# Altium schematic sheet MainCurrent.SchDoc
size A4; SheetNumber: 13; SheetTotal: 15
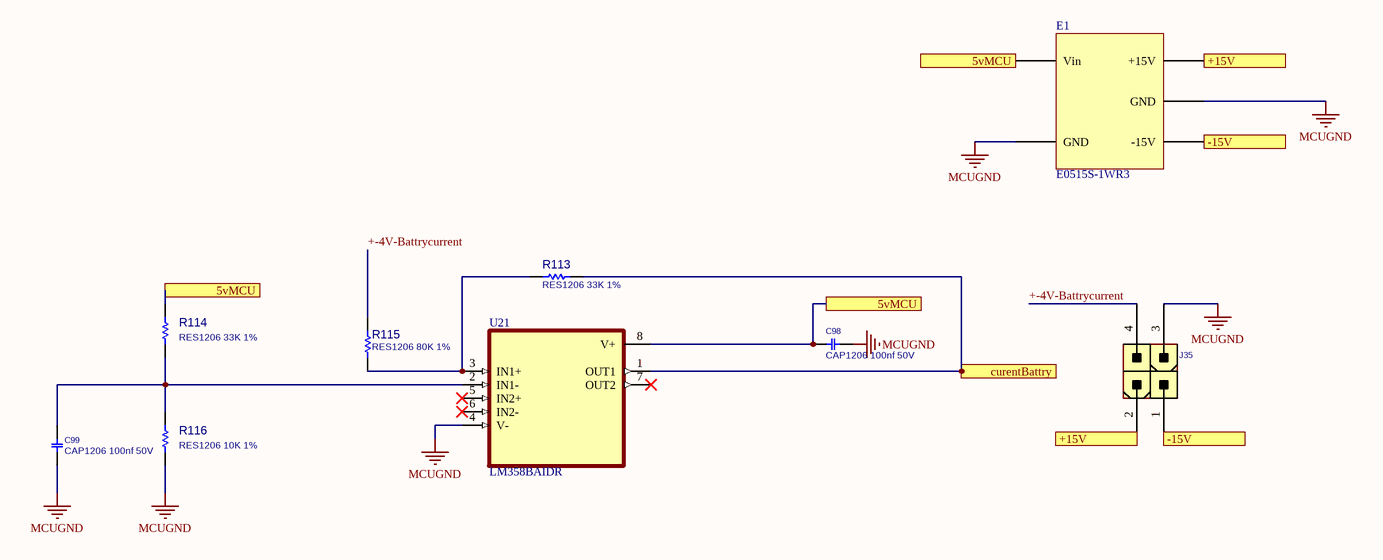
[diagram p0: MainCurrent.SchDoc]

## Parts
C98  CAP1206 100nf 50V  [C1206]
C99  CAP1206 100nf 50V  [C1206]
E1  E0515S-1WR3  [PCBComponent_1]
J35  CONN_ATXPWR_4  [ATXPWR_4]  (value not drawn)
R113  RES1206 33K 1%  [R1206]
R114  RES1206 33K 1%  [R1206]
R115  RES1206 80K 1%  [R1206]
R116  RES1206 10K 1%  [R1206]
U21  LM358BAIDR  [SOIC127P599X175-8N]

## Ports
5vMCU, +15V, -15V, curentBattry

## Nets
MCUGND: C98.1 C99.1 E1.1(GND) E1.3(GND) J35.3 R116.1 U21.4(V-)
5vMCU: C98.2 E1.0(Vin) R114.2 U21.8(V+) ; port 5vMCU
+15V: E1.4(+15V) J35.2 ; port +15V
+-4V-Battrycurrent: J35.4 R115.2
-15V: E1.2(-15V) J35.1 ; port -15V
curentBattry: R113.2 U21.1(OUT1) ; port curentBattry
NetC99_2: C99.2 R114.1 R116.2 U21.2(IN1-)
NetR113_1: R113.1 R115.1 U21.3(IN1+)

Not connected (* = marked no-connect by the designer): U21 5(IN2+)* 6(IN2-)* 7(OUT2)*

## Library data of the parts
C98 C99 = CAP_SMD_MLCC_1206: CAP, MLCC; PARAM: -, -%; MANF_P#: MANF_PART#; PARAM2: -V; PRICE: 100= 1$; MANF: -; ASSEMBLY: ASSEMBLY
E1 = a0505s-?
J35 = CONN_ATXPWR_4: CONN, ATX POWER, 4 P; MANF: TE, Molex; MANF_P#: 4-1775099-0, 39281043; VALUE: CONN_ATXPWR_4; MountType: THD; PACKAGE: ATXPWR-4pin; Part Type: Conn.
R113-R116 = RES_SMD_1206: RESISTOR, SMD; PARAM: 1%, 0.25W; DESC: DESCRIPTION; DIST#: MOUSER; MANF_P#: -; MANF: -; ASSEMBLY: ASSEMBLY; PRICE: -; PARAM2: -
U21 = LM358BAIDR: Dual, 36-V, 1.2-MHz, 2-mV offset voltage operational amplifier; MF: Texas Instruments; SnapEDA_Link: https://www.snapeda.com/parts/LM358BAIDR/Texas+Instruments/view-part/?ref=snap; Package: SOIC-8 Texas Instruments; Value: *; MP: LM358BAIDR; Check_prices: https://www.snapeda.com/parts/LM358BAIDR/Texas+Instruments/view-part/?ref=eda